# Altium schematic sheet DIO_1.SchDoc
size 420 x 297 mm; SheetNumber: 11; SheetTotal: 26
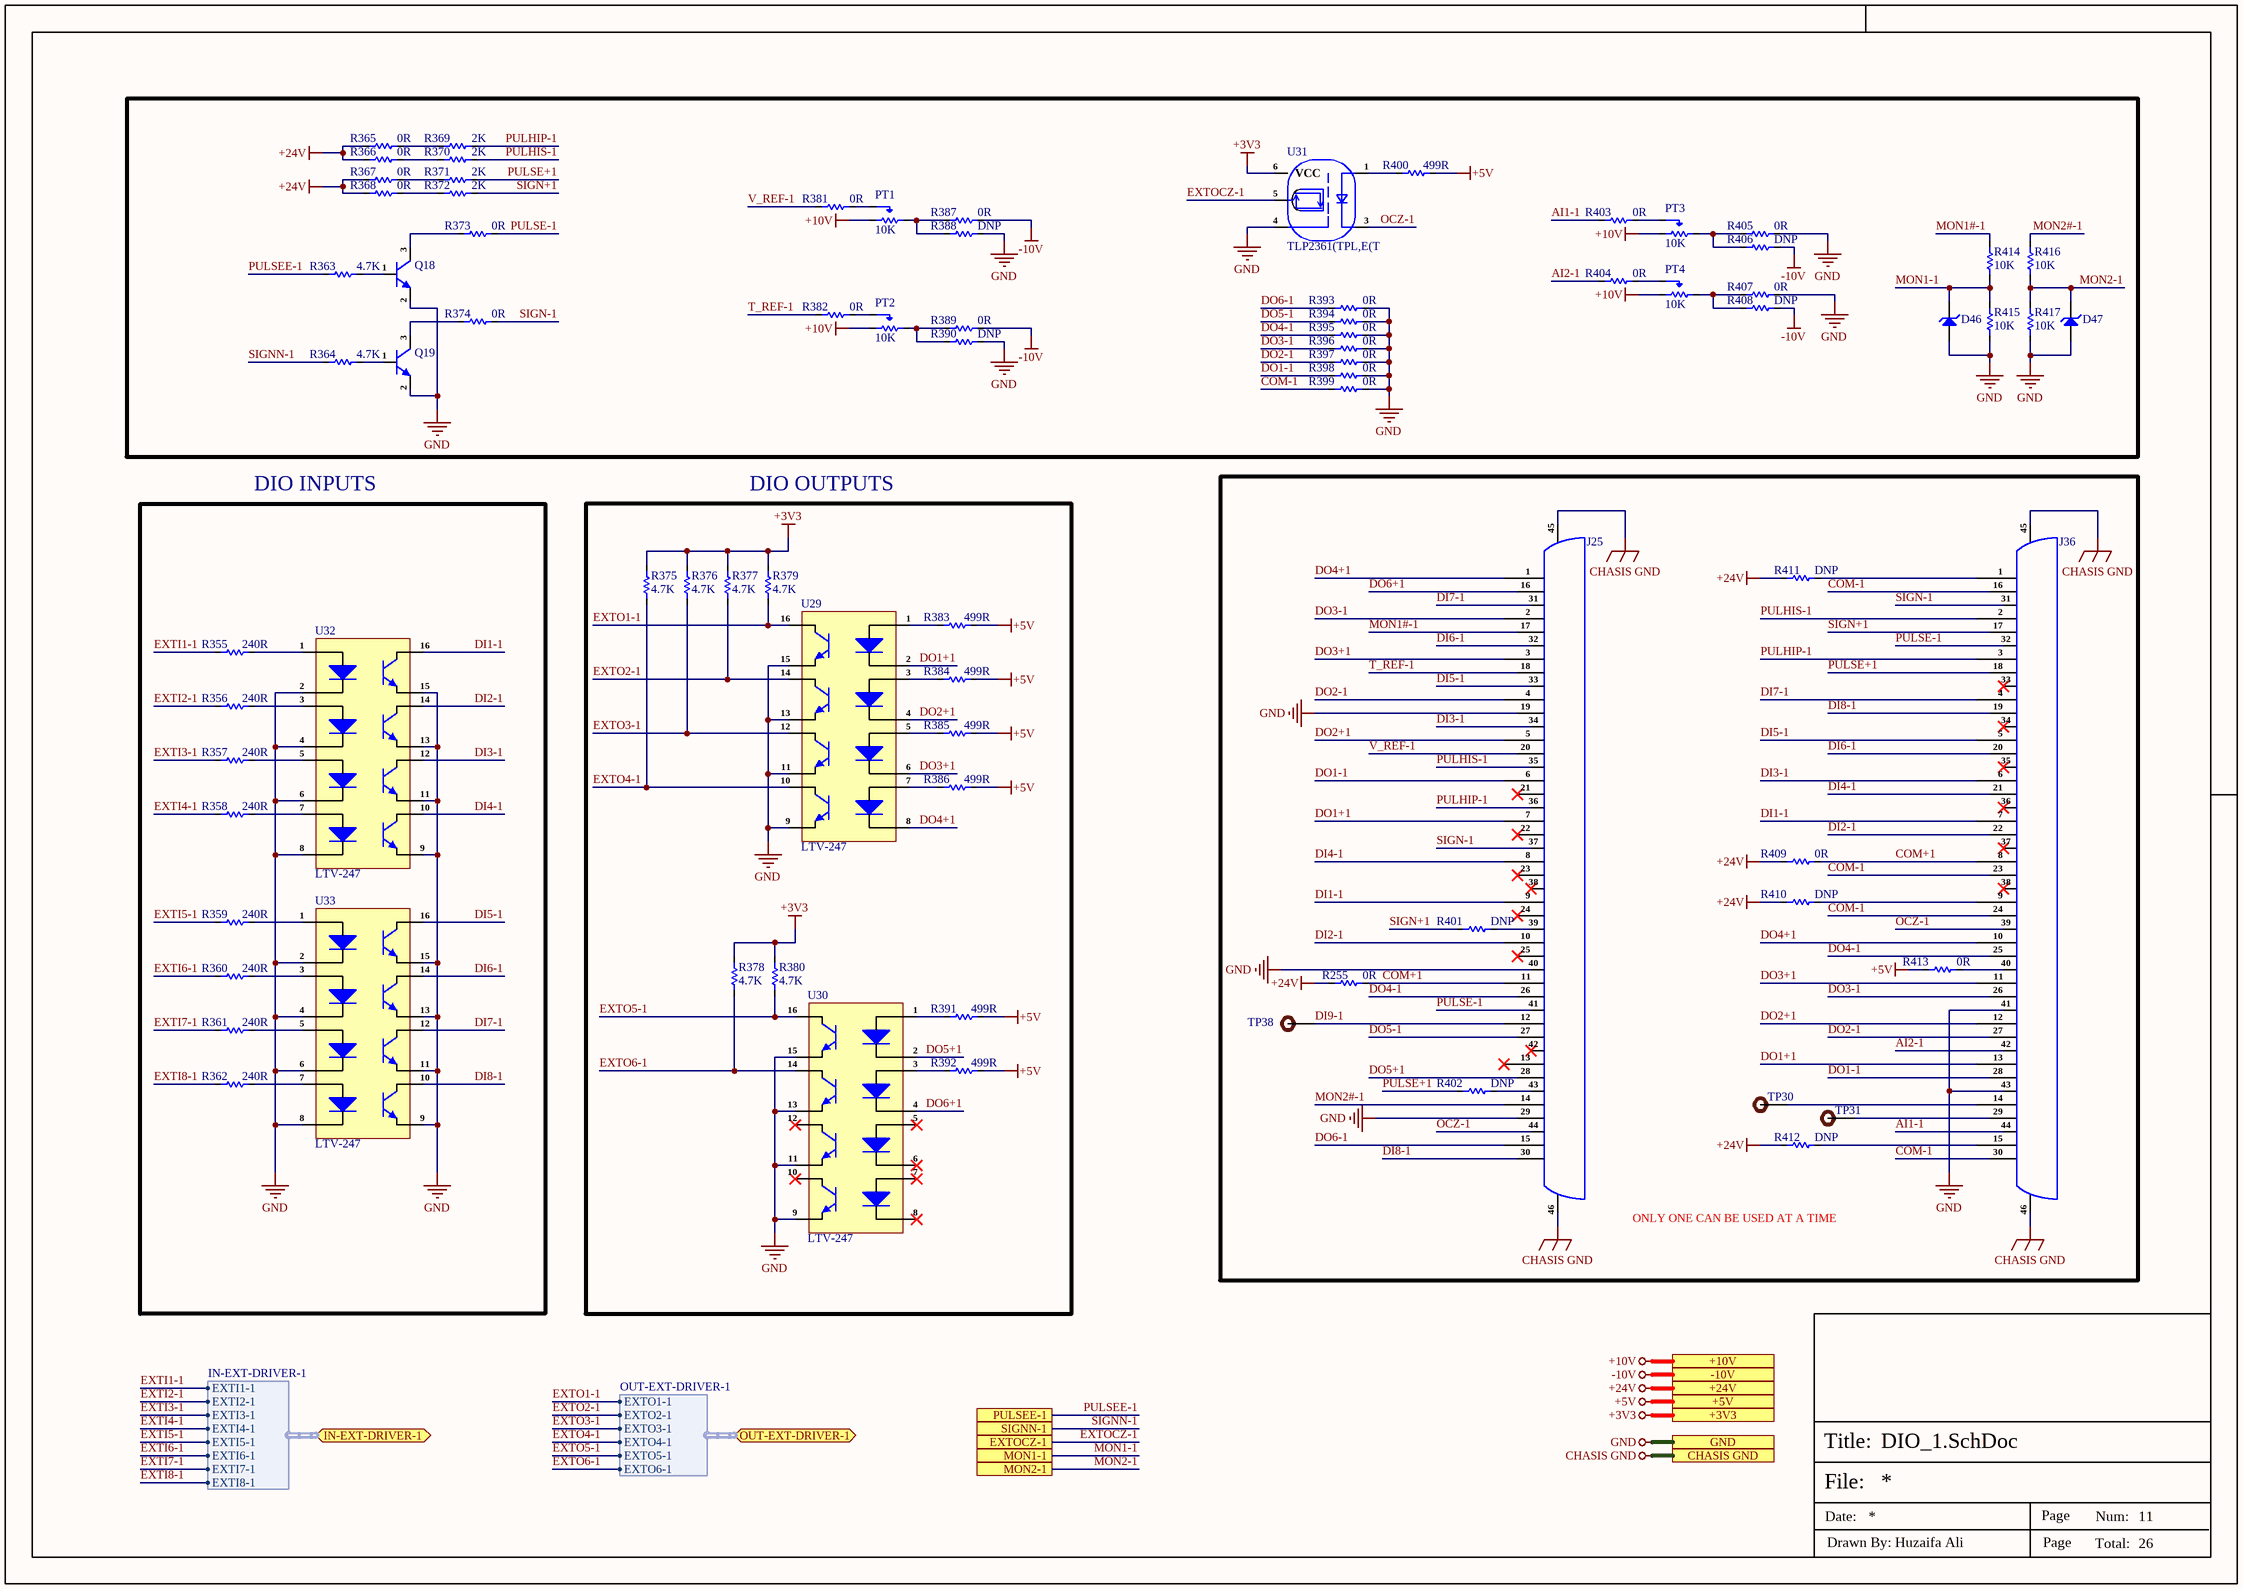
[diagram p0: DIO_1.SchDoc]

## Parts
D46  MM3Z3V3B  [SOD323F]  (value not drawn)
D47  MM3Z3V3B  [SOD323F]  (value not drawn)
J25  DS1038-44FBNSIA74-0CC  [DS1038-44FBNSIA74-0CC]  (value not drawn)
J36  DS1038-44FBNSIA74-0CC  [DS1038-44FBNSIA74-0CC]  (value not drawn)
PT1  10K  [3313J-1-103E]
PT2  10K  [3313J-1-103E]
PT3  10K  [3313J-1-103E]
PT4  10K  [3313J-1-103E]
Q18  NSS40201LT1G  [SOT-23]  (value not drawn)
Q19  NSS40201LT1G  [SOT-23]  (value not drawn)
R255  0R  [Res-0603]
R355  240R  [Res-0402]
R356  240R  [Res-0402]
R357  240R  [Res-0402]
R358  240R  [Res-0402]
R359  240R  [Res-0402]
R360  240R  [Res-0402]
R361  240R  [Res-0402]
R362  240R  [Res-0402]
R363  4.7K  [Res-0402]
R364  4.7K  [Res-0402]
R365  0R  [Res-0402]
R366  0R  [Res-0402]
R367  0R  [Res-0402]
R368  0R  [Res-0402]
R369  2K  [Res-0402]
R370  2K  [Res-0402]
R371  2K  [Res-0402]
R372  2K  [Res-0402]
R373  0R  [Res-0402]
R374  0R  [Res-0402]
R375  4.7K  [Res-0402]
R376  4.7K  [Res-0402]
R377  4.7K  [Res-0402]
R378  4.7K  [Res-0402]
R379  4.7K  [Res-0402]
R380  4.7K  [Res-0402]
R381  0R  [Res-0402]
R382  0R  [Res-0402]
R383  499R  [Res-0402]
R384  499R  [Res-0402]
R385  499R  [Res-0402]
R386  499R  [Res-0402]
R387  0R  [Res-0402]
R388  DNP  [Res-0402]
R389  0R  [Res-0402]
R390  DNP  [Res-0402]
R391  499R  [Res-0402]
R392  499R  [Res-0402]
R393  0R  [Res-0402]
R394  0R  [Res-0402]
R395  0R  [Res-0402]
R396  0R  [Res-0402]
R397  0R  [Res-0402]
R398  0R  [Res-0402]
R399  0R  [Res-0402]
R400  499R  [Res-0402]
R401  DNP  [Res-0402]
R402  DNP  [Res-0402]
R403  0R  [Res-0402]
R404  0R  [Res-0402]
R405  0R  [Res-0402]
R406  DNP  [Res-0402]
R407  0R  [Res-0402]
R408  DNP  [Res-0402]
R409  0R  [Res-0402]
R410  DNP  [Res-0402]
R411  DNP  [Res-0402]
R412  DNP  [Res-0402]
R413  0R  [Res-0402]
R414  10K  [Res-0402]
R415  10K  [Res-0402]
R416  10K  [Res-0402]
R417  10K  [Res-0402]
TP30  TEST POINT 0.5mm Dia  [Test-point - 0.5mm]  (value not drawn)  (no BOM)
TP31  TEST POINT 0.5mm Dia  [Test-point - 0.5mm]  (value not drawn)  (no BOM)
TP38  TEST POINT 0.5mm Dia  [Test-point - 0.5mm]  (value not drawn)  (no BOM)
U29  LTV-247  [16-SO]
U30  LTV-247  [16-SO]
U31  TLP2361(TPL,E(T  [SO-5]
U32  LTV-247  [16-SO]
U33  LTV-247  [16-SO]

## Blocks framed on the sheet
ONLY ONE CAN BE USED AT A TIME: J25 J36 R255 R401 R402 R409-R413 TP30 TP31 TP38

## Ports
+3V3 (see Servo1[5B], CAN_Sheet[4D], Controller_Sheet[5D], DIO_2[5D], DIO_3[5D], DIO_4[5D], Encoder_Sheet1[5D], Encoder_Sheet2[4D], Encoder_Sheet3[4D], Encoder_Sheet4[5D], EtherCAT_Sheet[5D], Motor_Driver_Sheet1[5D], Motor_Driver_Sheet2[5D], Motor_Driver_Sheet3[5D], Motor_Driver_Sheet4[5D], Power_Sheet[5D], RS485_RS232_Sheet[5D], Sec_Controller_Sheet1[5D], Sec_Controller_Sheet2[5D], Sec_Controller_Sheet3[5D], Sec_Controller_Sheet4[5D], Servo1[5D], Servo2[5D], Servo3[5D], Servo4[5D]), +5V (see Servo1[5A], CAN_Sheet[4D], Controller_Sheet[5D], DIO_2[5D], DIO_3[5D], DIO_4[5D], Encoder_Sheet1[5D], Encoder_Sheet2[4D], Encoder_Sheet3[4D], Encoder_Sheet4[5D], Power_Sheet[5D], Servo1[5D], Servo2[5D], Servo3[5D], Servo4[5D]), +10V (see Servo1[5A], DIO_2[5D], DIO_3[5D], DIO_4[5D], Power_Sheet[5D], Servo1[5D], Servo2[5D], Servo3[5D], Servo4[5D]), +24V (see Servo1[5A], DIO_2[5D], DIO_3[5D], DIO_4[5D], Power_Sheet[5D], Servo1[5D], Servo2[5D], Servo3[5D], Servo4[5D]), -10V (see Servo1[5A], DIO_2[5D], DIO_3[5D], DIO_4[5D], Power_Sheet[5D], Servo1[5D], Servo2[5D], Servo3[5D], Servo4[5D]), CHASIS GND (see Servo1[5B], DIO_2[5D], DIO_3[5D], DIO_4[5D], Encoder_Sheet1[5D], Encoder_Sheet2[4D], Encoder_Sheet3[4D], Encoder_Sheet4[5D], EtherCAT_Sheet[5D], Power_Sheet[5D], Servo1[5D], Servo2[5D], Servo3[5D], Servo4[5D]), EXTOCZ-1 (see Servo1[5B], Sec_Controller_Sheet1[5D]), GND (see Servo1[5B], CAN_Sheet[4D], Controller_Sheet[5D], DIO_2[5D], DIO_3[5D], DIO_4[5D], Encoder_Sheet1[5D], Encoder_Sheet2[4D], Encoder_Sheet3[4D], Encoder_Sheet4[5D], EtherCAT_Sheet[5D], Motor_Driver_Sheet1[5D], Motor_Driver_Sheet2[5D], Motor_Driver_Sheet3[5D], Motor_Driver_Sheet4[5D], Power_Sheet[5D], RS485_RS232_Sheet[5D], Sec_Controller_Sheet1[5D], Sec_Controller_Sheet2[5D], Sec_Controller_Sheet3[5D], Sec_Controller_Sheet4[5D], Servo1[5D], Servo2[5D], Servo3[5D], Servo4[5D]), IN-EXT-DRIVER-1 (bidir, harness IN-EXT-DRIVER-1, see Servo1[5B], Sec_Controller_Sheet1[3D]), MON1-1 (see Servo1[5B], Sec_Controller_Sheet1[5D]), MON2-1 (see Servo1[5B], Sec_Controller_Sheet1[5D]), OUT-EXT-DRIVER-1 (bidir, harness OUT-EXT-DRIVER-1, see Servo1[5B], Sec_Controller_Sheet1[3D]), PULSEE-1 (see Servo1[5B], Sec_Controller_Sheet1[5D]), SIGNN-1 (see Servo1[5B], Sec_Controller_Sheet1[5D])

## Harnesses
IN-EXT-DRIVER-1: EXTI1-1, EXTI2-1, EXTI3-1, EXTI4-1, EXTI5-1, EXTI6-1, EXTI7-1, EXTI8-1
OUT-EXT-DRIVER-1: EXTO1-1, EXTO2-1, EXTO3-1, EXTO4-1, EXTO5-1, EXTO6-1

## Nets
+3V3: R375.2 R376.2 R377.2 R378.2 R379.2 R380.2 U31.6(VCC) ; port +3V3
+5V: R383.2 R384.2 R385.2 R386.2 R391.2 R392.2 R400.2 R413.1 ; port +5V
+10V: PT1.1(CCW) PT2.1(CCW) PT3.1(CCW) PT4.1(CCW) ; port +10V
+24V: R255.1 R365.1 R366.1 R367.1 R368.1 R409.1 R410.1 R411.1 R412.1 ; port +24V
-10V: R387.2 R389.2 R406.2 R408.2 ; port -10V
CHASIS GND: J25.45 J25.46 J36.45 J36.46 ; port CHASIS GND
GND: D46.1(A) D47.1(A) J25.19 J25.29 J25.40 J36.41 J36.43 Q18.2(E) Q19.2(E) R388.2 R390.2 R393.2 R394.2 R395.2 R396.2 R397.2 R398.2 R399.2 R405.2 R407.2 R415.1 R417.1 U29.9(E) U29.11(E) U29.13(E) U29.15(E) U30.9(E) U30.11(E) U30.13(E) U30.15(E) U31.4(GND) U32.2(K) U32.4(K) U32.6(K) U32.8(K) U32.9(E) U32.11(E) U32.13(E) U32.15(E) U33.2(K) U33.4(K) U33.6(K) U33.8(K) U33.9(E) U33.11(E) U33.13(E) U33.15(E) ; port GND
AI1-1: J36.44 R403.1
AI2-1: J36.42 R404.1
COM+1: J25.11 J36.8 R255.2 R409.2
COM-1: J36.16 J36.23 J36.24 J36.30 R399.1
DI1-1: J25.9 J36.7 U32.16(C)
DI2-1: J25.10 J36.22 U32.14(C)
DI3-1: J25.34 J36.6 U32.12(C)
DI4-1: J25.8 J36.21 U32.10(C)
DI5-1: J25.33 J36.5 U33.16(C)
DI6-1: J25.32 J36.20 U33.14(C)
DI7-1: J25.31 J36.4 U33.12(C)
DI8-1: J25.30 J36.19 U33.10(C)
DI9-1: J25.12 TP38.1
DO1+1: J25.7 J36.13 U29.2(K)
DO1-1: J25.6 J36.28 R398.1
DO2+1: J25.5 J36.12 U29.4(K)
DO2-1: J25.4 J36.27 R397.1
DO3+1: J25.3 J36.11 U29.6(K)
DO3-1: J25.2 J36.26 R396.1
DO4+1: J25.1 J36.10 U29.8(K)
DO4-1: J25.26 J36.25 R395.1
DO5+1: J25.28 U30.2(K)
DO5-1: J25.27 R394.1
DO6+1: J25.16 U30.4(K)
DO6-1: J25.15 R393.1
EXTI1-1: R355.1 ; port IN-EXT-DRIVER-1.EXTI1-1
EXTI2-1: R356.1 ; port IN-EXT-DRIVER-1.EXTI2-1
EXTI3-1: R357.1 ; port IN-EXT-DRIVER-1.EXTI3-1
EXTI4-1: R358.1 ; port IN-EXT-DRIVER-1.EXTI4-1
EXTI5-1: R359.1 ; port IN-EXT-DRIVER-1.EXTI5-1
EXTI6-1: R360.1 ; port IN-EXT-DRIVER-1.EXTI6-1
EXTI7-1: R361.1 ; port IN-EXT-DRIVER-1.EXTI7-1
EXTI8-1: R362.1 ; port IN-EXT-DRIVER-1.EXTI8-1
EXTO1-1: R379.1 U29.16(C) ; port OUT-EXT-DRIVER-1.EXTO1-1
EXTO2-1: R377.1 U29.14(C) ; port OUT-EXT-DRIVER-1.EXTO2-1
EXTO3-1: R376.1 U29.12(C) ; port OUT-EXT-DRIVER-1.EXTO3-1
EXTO4-1: R375.1 U29.10(C) ; port OUT-EXT-DRIVER-1.EXTO4-1
EXTO5-1: R380.1 U30.16(C) ; port OUT-EXT-DRIVER-1.EXTO5-1
EXTO6-1: R378.1 U30.14(C) ; port OUT-EXT-DRIVER-1.EXTO6-1
EXTOCZ-1: U31.5(VO) ; port EXTOCZ-1
MON1#-1: J25.17 R414.2
MON1-1: D46.2(K) R414.1 R415.2 ; port MON1-1
MON2#-1: J25.14 R416.2
MON2-1: D47.2(K) R416.1 R417.2 ; port MON2-1
OCZ-1: J25.44 J36.39 U31.3(CAT)
PULHIP-1: J25.36 J36.3 R369.2
PULHIS-1: J25.35 J36.2 R370.2
PULSE+1: J36.18 R371.2 R402.1
PULSE-1: J25.41 J36.32 R373.2
PULSEE-1: R363.1 ; port PULSEE-1
SIGN+1: J36.17 R372.2 R401.1
SIGN-1: J25.37 J36.31 R374.2
SIGNN-1: R364.1 ; port SIGNN-1
T_REF-1: J25.18 R382.1
V_REF-1: J25.20 R381.1
NetJ25_39: J25.39 R401.2
NetJ25_43: J25.43 R402.2
NetJ36_1: J36.1 R411.2
NetJ36_9: J36.9 R410.2
NetJ36_14: J36.14 TP30.1
NetJ36_15: J36.15 R412.2
NetJ36_29: J36.29 TP31.1
NetJ36_40: J36.40 R413.2
NetPT1_2: PT1.2(Wiper) R381.2
NetPT1_3: PT1.3(CW) R387.1 R388.1
NetPT2_2: PT2.2(Wiper) R382.2
NetPT2_3: PT2.3(CW) R389.1 R390.1
NetPT3_2: PT3.2(Wiper) R403.2
NetPT3_3: PT3.3(CW) R405.1 R406.1
NetPT4_2: PT4.2(Wiper) R404.2
NetPT4_3: PT4.3(CW) R407.1 R408.1
NetQ18_1: Q18.1(B) R363.2
NetQ18_3: Q18.3(C) R373.1
NetQ19_1: Q19.1(B) R364.2
NetQ19_3: Q19.3(C) R374.1
NetR355_2: R355.2 U32.1(A)
NetR356_2: R356.2 U32.3(A)
NetR357_2: R357.2 U32.5(A)
NetR358_2: R358.2 U32.7(A)
NetR359_2: R359.2 U33.1(A)
NetR360_2: R360.2 U33.3(A)
NetR361_2: R361.2 U33.5(A)
NetR362_2: R362.2 U33.7(A)
NetR365_2: R365.2 R369.1
NetR366_2: R366.2 R370.1
NetR367_2: R367.2 R371.1
NetR368_2: R368.2 R372.1
NetR383_1: R383.1 U29.1(A)
NetR384_1: R384.1 U29.3(A)
NetR385_1: R385.1 U29.5(A)
NetR386_1: R386.1 U29.7(A)
NetR391_1: R391.1 U30.1(A)
NetR392_1: R392.1 U30.3(A)
NetR400_1: R400.1 U31.1(AN)

Not connected (* = marked no-connect by the designer): J25 13* 21* 22* 23* 24* 25* 38* 42*; J36 33* 34* 35* 36* 37* 38*; U30 5(A)* 6(K)* 7(A)* 8(K)* 10(C)* 12(C)*

## Notes on the sheet
- DIO INPUTS
- DIO OUTPUTS
- File:
- Title:
- Date:
- Page
- Num:
- Total:
- Drawn By: Huzaifa Ali

## Library data of the parts
D46 D47 = MM3Z3V3B: DIODE ZENER 3.3V 200MW SOD323F; Manufacturer: ON Semiconductor / Fairchild; Forward Voltage: 1V; Tolerance: 2%; Impedance: 89R; Max Reverse Leakage Current: 4.5uA; Test Current: 5mA; Element Configuration: Single; Supplier 1: Digi-Key; Manufacturer Part Number: MM3Z3V3B; Stock 1: 473644; Pricing 1: 1=0.22, 10=0.18, 100=0.0956, 500=0.06288, 1000=0.04276 (USD); Mount: Surface Mount; Number of Pins: 2; Weight: 0.0276g; Min Operating Temperature: -65°C; Max Operating Temperature: 150°C; Packaging: Tape and Reel; Package Quantity: 1; Max Power Dissipation: 200mW; Zener Voltage: 3.3V; Voltage Tolerance: 2%; Power Dissipation: 200mW; Working Voltage: 3.3V; Peak Reverse Current: 4.5uA; Length: 1.3mm; Height: 1mm; Width: 1.7mm; Radiation Hardening: No; REACH SVHC: No SVHC; Lead Free: Lead Free; ComponentLink1URL: http://www.onsemi.com/pub/Collateral/MM3Z9V1B-D.pdf?src-supplier=Digi-Key; ComponentLink1Description: http://www.onsemi.com/pub/Collateral/MM3Z9V1B-D.pdf?src-supplier=Digi-Key; ComponentLink2URL: http://www.mouser.com/ds/2/149/MM3Z3V3B-187166.pdf?src-supplier=Mouser; ComponentLink2Description: http://www.mouser.com/ds/2/149/MM3Z3V3B-187166.pdf?src-supplier=Mouser; ComponentLink3URL: https://www.fairchildsemi.com/datasheets/MM/MM3Z9V1B.pdf?src-supplier=Avnet; ComponentLink3Description: https://www.fairchildsemi.com/datasheets/MM/MM3Z9V1B.pdf?src-supplier=Avnet; ComponentLink4URL: http://www.farnell.com/datasheets/1706525.pdf?src-supplier=Element14; ComponentLink4Description: http://www.farnell.com/datasheets/1706525.pdf?src-supplier=Element14; Supplier Part Number 1: MM3Z3V3BCT-ND; LCSC Part Number: C2978865; Item Type: Diode
J25 J36 = DS1038-44FBNSIA74-0CC: 44P Female D-Sub Right-Angle 3 1.5A -40℃~+105℃ Push-Pull D-Sub / VGA connector ROHS; Manufacturer: CONNFLY Elec; Manufacturer Part Number: DS1038-44FBNSIA74-0CC; Package: Push-Pull; LCSC Part Number: C77844; Item Type: D-Sub / VGA connector; ComponentLink1Description: LCSC; ComponentLink1URL: https://www.lcsc.com/product-detail/D-Sub-VGA-connector_CONNFLY-Elec-DS1038-44FBNSIA74-0CC_C77844.html
PT1-PT4 = 3313J-1-103E: TRIMMER 10KOHM 0.125W J LEAD TOP; Manufacturer: Bourns; Value: 10kR; Tolerance: 20%; Power Rating: 125mW; Number of Turns: 1; Temperature Coefficient: 100ppm/°C; Insulation Resistance: 100MR; Voltage Rating (DC): 500V; Item Type: Potentiometer; Supplier 1: Digi-Key; Manufacturer Part Number: 3313J-1-103E; RoHS: Yes; Category: Variable Resistors and Potentiometers; Stock 1: 15653; Pricing 1: 1=1.83, 10=1.611, 25=1.4444, 50=1.3888, 100=1.3332, 250=1.27764, 500=1.05544 (USD); Mounting Technology: Surface Mount; Weight: 283mg; Color: Natural; Min Operating Temperature: -55°C; Max Operating Temperature: 125°C; Resistor Type: Cermet; Package Quantity: 1000; Packaging: Tape and Reel; Termination: J-Hook; Taper: Linear; Max Power Dissipation: 125mW; Type: Potentiometer; Series: Trimpot® 3313 - Sealed; Resistance Tolerance: 20%; Technology: CERMET; Length: 3.2mm; Width: 3.2mm; Height: 2.2mm; Depth: 3.5mm; Radiation Hardening: No; Reach SVHC Compliant: No; Military Standard: Not; Lead Free: Lead Free; RoHS Compliant: Yes; ComponentLink1URL: https://datasheet.ciiva.com/6197/1719390-6197392.pdf?src-supplier=Farnell; ComponentLink1Description: https://datasheet.ciiva.com/6197/1719390-6197392.pdf?src-supplier=Farnell; ComponentLink2URL: https://datasheet.ciiva.com/11831/0900766b80dbb89c-11831555.pdf?src-supplier=Rs; ComponentLink2Description: https://datasheet.ciiva.com/11831/0900766b80dbb89c-11831555.pdf?src-supplier=Rs; ComponentLink3URL: https://datasheet.ciiva.com/43573/1157501-43573718.pdf?src-supplier=Jameco; ComponentLink3Description: https://datasheet.ciiva.com/43573/1157501-43573718.pdf?src-supplier=Jameco; ComponentLink4URL: https://datasheet.ciiva.com/7953/1864507-7953225.pdf?src-supplier=Element14; ComponentLink4Description: https://datasheet.ciiva.com/7953/1864507-7953225.pdf?src-supplier=Element14; ComponentLink5URL: https://datasheet.ciiva.com/28659/1770668-28659191.pdf?src-supplier=Element14; ComponentLink5Description: https://datasheet.ciiva.com/28659/1770668-28659191.pdf?src-supplier=Element14; ComponentLink6URL: https://datasheet.ciiva.com/2156/3313-2156355.pdf?src-supplier=Digi-Key; ComponentLink6Description: https://datasheet.ciiva.com/2156/3313-2156355.pdf?src-supplier=Digi-Key; ComponentLink7URL: https://datasheet.ciiva.com/2156/3313-2156356.pdf?src-supplier=Digi-Key; ComponentLink7Description: https://datasheet.ciiva.com/2156/3313-2156356.pdf?src-supplier=Digi-Key; ComponentLink8URL: https://datasheet.ciiva.com/2156/3313-2156354.pdf?src-supplier=Digi-Key; ComponentLink8Description: https://datasheet.ciiva.com/2156/3313-2156354.pdf?src-supplier=Digi-Key; ComponentLink9URL: https://datasheet.ciiva.com/16715/70153423-16715693.pdf?src-supplier=Allied+Electronics; ComponentLink9Description: https://datasheet.ciiva.com/16715/70153423-16715693.pdf?src-supplier=Allied+Electronics; Supplier Part Number 1: 3313J-103ECT-ND; LCSC Part Number: C124616
Q18 Q19 = NSS40201LT1G: TRANS NPN 40V 2A SOT23-3; Manufacturer: ON Semiconductor; Max Power Dissipation: 540mW; Transition Frequency: 150MHz; hFE Min: 200; Number of Elements: 1; Emitter Base Voltage (VEBO): 6V; Collector Emitter Saturation Voltage: 115mV; Element Configuration: Single; Clock Frequency: 100MHz; Item Type: Transistor; Supplier 1: Future Electronics; Manufacturer Part Number: NSS40201LT1G; RoHS: Yes; Category: BJTs; Stock 1: 155; Pricing 1: 1=0.42000, 15=0.34000, 75=0.29500, 300=0.25500, 1500=0.21000 (USD); Case/Package: SOT-23-3; Pins: 3; Min Operating Temperature: -55°C; Max Operating Temperature: 150°C; Collector Emitter Voltage (VCEO): 40V; Packaging: Tape and Reel; Max Collector Current: 2A; Collector Emitter Breakdown Voltage: 40V; Polarity: NPN; Package Quantity: 3000; Frequency: 150MHz; Max Breakdown Voltage: 40V; Collector Base Voltage (VCBO): 40V; Power Dissipation: 540mW; Gain Bandwidth Product: 150MHz; Series: -; Collector-emitter Voltage-Max: 115mV; Length: 3.04mm; Width: 2.64mm; Height: 1.11mm; Radiation Hardening: No; Lead Free: Lead Free; Reach SVHC Compliant: Yes; Halogen Free: Halogen Free; RoHS Compliant: Yes; ComponentLink1URL: https://datasheet.ciiva.com/976/nss40201l-d-976800.pdf?src-supplier=Digi-Key; ComponentLink1Description: https://datasheet.ciiva.com/976/nss40201l-d-976800.pdf?src-supplier=Digi-Key; ComponentLink2URL: https://datasheet.ciiva.com/11204/nss40201l-d-11204882.pdf?src-supplier=Avnet; ComponentLink2Description: https://datasheet.ciiva.com/11204/nss40201l-d-11204882.pdf?src-supplier=Avnet; ComponentLink3URL: https://datasheet.ciiva.com/16291/nss40201l-d-115376-16291797.pdf?src-supplier=Mouser; ComponentLink3Description: https://datasheet.ciiva.com/16291/nss40201l-d-115376-16291797.pdf?src-supplier=Mouser; ComponentLink4URL: https://datasheet.ciiva.com/30480/0900766b8121b5a5-30480502.pdf?src-supplier=Rs; ComponentLink4Description: https://datasheet.ciiva.com/30480/0900766b8121b5a5-30480502.pdf?src-supplier=Rs; ComponentLink5URL: https://datasheet.ciiva.com/976/nss40201l-d-976801.pdf?src-supplier=Digi-Key; ComponentLink5Description: https://datasheet.ciiva.com/976/nss40201l-d-976801.pdf?src-supplier=Digi-Key; ComponentLink6URL: https://datasheet.ciiva.com/976/nss40201l-d-976802.pdf?src-supplier=Digi-Key; ComponentLink6Description: https://datasheet.ciiva.com/976/nss40201l-d-976802.pdf?src-supplier=Digi-Key; ComponentLink7URL: https://datasheet.ciiva.com/22641/nss40201l-d-22641179.pdf?src-supplier=Farnell; ComponentLink7Description: https://datasheet.ciiva.com/22641/nss40201l-d-22641179.pdf?src-supplier=Farnell; ComponentLink8URL: https://datasheet.ciiva.com/16222/nss40201l-d-16222093.pdf?src-supplier=Future+Electronics; ComponentLink8Description: https://datasheet.ciiva.com/16222/nss40201l-d-16222093.pdf?src-supplier=Future+Electronics; Supplier Part Number 1: 6030674; LCSC Part Number: C145175
R255 = RC0603JR-070RL: RES 0 OHM JUMPER 1/10W 0603; Manufacturer: Yageo; Resistance: 0mR; Tolerance: 1%; Power Rating: 100mW; Voltage Rating (DC): 50V; Temperature Coefficient: 200ppm/°C; Resistance Tolerance: 5%; Item Type: Resistor; Supplier 1: Digi-Key; Manufacturer Part Number: RC0603JR-070RL; RoHS: Yes; Category: Chip SMD Resistors; Stock 1: 18081776; Pricing 1: 1=0.10000, 10=0.01700, 25=0.01240, 50=0.00960, 100=0.00700, 250=0.00536, 500=0.00430, 1000=0.00316 (USD); Case/Package: 0603; Number of Pins: 2; Contact Plating: Tin,Matte; Case Code (Imperial): 0603; Case Code (Metric): 1608; Size Code: 0603; Min Operating Temperature: -55°C; Max Operating Temperature: 155°C; Resistor Type: Thick Film; Packaging: Tape and Reel; Termination: SMD/SMT; Series: RC; Technology: THICK FILM; Package Quantity: 5000; Voltage Rating: 50V; Features: Moisture Resistant; Max Power Dissipation: 100mW; Number of Terminations: 2; Construction: Rectangular; Length: 1.6mm; Width: 0.8mm; Height: 0.45mm; Depth: 0.8mm; Radiation Hardening: No; Reach SVHC Compliant: No SVHC; Lead Free: Lead Free; RoHS Compliant: Yes; Military Standard: Not; Supplier Part Number 1: 311-0.0GRCT-ND; LCSC Part Number: C95177
R355-R362 = RC0402FR-07240RL: RES 240 OHM 1% 1/16W 0402; Manufacturer: Yageo; Item Type: Resistors; Power Rating: 63mW; Temperature Coefficient: 100ppm/°C; Voltage Rating (DC): 50V; Supplier 1: Mouser; Manufacturer Part Number: RC0402FR-07240RL; RoHS: Yes; Stock 1: 1903202; Pricing 1: 1=0.10000, 10=0.01200, 50=0.01200, 100=0.00500, 1000=0.00300, 10000=0.00100 (USD); Case/Package: 0402; Case Code (Metric): 1005; Case Code (Imperial): 0402; Size Code: 0402; Min Operating Temperature: -55°C; Max Operating Temperature: 155°C; Resistance: 240R; Tolerance: 1%; Packaging: Tape and Reel; Resistor Type: Thick Film; Voltage Rating: 50V; Package Quantity: 1; Number of Terminations: 2; Termination: SMD/SMT; Max Power Dissipation: 63mW; Features: Moisture Resistant; Series: RC; Construction: Rectangular; Resistance Tolerance: 1%; Length: 1mm; Width: 0.02inch; Height: 0.016inch; Depth: 0.5mm; REACH SVHC: Unknown; Lead Free: Lead Free; RoHS Compliant: Yes; Military Standard: Not; ComponentLink1URL: https://datasheet.ciiva.com/7849/1018594-7849915.pdf?src-supplier=Element14; ComponentLink1Description: https://datasheet.ciiva.com/7849/1018594-7849915.pdf?src-supplier=Element14; ComponentLink2URL: https://datasheet.ciiva.com/7849/1018594-7849916.pdf?src-supplier=Element14; ComponentLink2Description: https://datasheet.ciiva.com/7849/1018594-7849916.pdf?src-supplier=Element14; ComponentLink3URL: https://datasheet.ciiva.com/2519/pyu-r-int-thick-7-2519157.pdf?src-supplier=Digi-Key; ComponentLink3Description: https://datasheet.ciiva.com/2519/pyu-r-int-thick-7-2519157.pdf?src-supplier=Digi-Key; ComponentLink4URL: https://datasheet.ciiva.com/2519/pyu-r-int-thick-7-2519158.pdf?src-supplier=Digi-Key; ComponentLink4Description: https://datasheet.ciiva.com/2519/pyu-r-int-thick-7-2519158.pdf?src-supplier=Digi-Key; ComponentLink5URL: https://datasheet.ciiva.com/2519/pyu-r-int-thick-7-2519156.pdf?src-supplier=Digi-Key; ComponentLink5Description: https://datasheet.ciiva.com/2519/pyu-r-int-thick-7-2519156.pdf?src-supplier=Digi-Key; ComponentLink6URL: https://datasheet.ciiva.com/12669/pyu-rc0402-51-rohs-l-6-r-12669689.pdf?src-supplier=Mouser; ComponentLink6Description: https://datasheet.ciiva.com/12669/pyu-rc0402-51-rohs-l-6-r-12669689.pdf?src-supplier=Mouser; ComponentLink7URL: https://datasheet.ciiva.com/17419/pyu-rc0402-51-rohs-l-6-r-17419482.pdf?src-supplier=Future+Electronics; ComponentLink7Description: https://datasheet.ciiva.com/17419/pyu-rc0402-51-rohs-l-6-r-17419482.pdf?src-supplier=Future+Electronics; Supplier Part Number 1: 603-RC0402FR-07240RL; LCSC Part Number: C114755
R363 R364 R375-R380 = RC0402FR-074K7L: RES 4.7K OHM 1% 1/16W 0402; Manufacturer: Yageo; Voltage Rating (DC): 50V; Power Rating: 62.5mW; Resistance: 4.7kR; Temperature Coefficient: 100ppm/°C; Max Power Dissipation: 63mW; Item Type: Resistor; Supplier 1: Avnet; Manufacturer Part Number: RC0402FR-074K7L; RoHS: Yes; Category: Chip SMD Resistors; Stock 1: 2420000; Pricing 1: 10000=0.00085 (USD); Case/Package: 0402; Number of Pins: 2; Case Code (Imperial): 0402; Case Code (Metric): 1005; Size Code: 0402; Min Operating Temperature: -55°C; Max Operating Temperature: 155°C; Tolerance: 1%; Voltage Rating: 50V; Packaging: Tape and Reel; Resistor Type: Thick Film; Termination: SMD/SMT; Features: Moisture Resistant; Series: RC; Number of Terminations: 2; Resistance Tolerance: 1%; Construction: Rectangular; Length: 1mm; Width: 0.5mm; Height: 0.32mm; Depth: 0.5mm; Height - Seated (Max): 0.016inch; RoHS Compliant: Yes; Reach SVHC Compliant: Yes; Military Standard: Not; Lead Free: Lead Free; ComponentLink1URL: https://datasheet.ciiva.com/22661/1686128-22661342.pdf?src-supplier=Element14; ComponentLink1Description: https://datasheet.ciiva.com/22661/1686128-22661342.pdf?src-supplier=Element14; ComponentLink2URL: https://datasheet.ciiva.com/7850/1018594-7850022.pdf?src-supplier=Element14; ComponentLink2Description: https://datasheet.ciiva.com/7850/1018594-7850022.pdf?src-supplier=Element14; ComponentLink3URL: https://datasheet.ciiva.com/7850/1018594-7850023.pdf?src-supplier=Element14; ComponentLink3Description: https://datasheet.ciiva.com/7850/1018594-7850023.pdf?src-supplier=Element14; ComponentLink4URL: https://datasheet.ciiva.com/15215/getdatasheetpartid-328119-15215035.pdf?src-supplier=Verical; ComponentLink4Description: https://datasheet.ciiva.com/15215/getdatasheetpartid-328119-15215035.pdf?src-supplier=Verical; Supplier Part Number 1: RC0402FR-074K7L; LCSC Part Number: C105871
R365-R368 R373 R374 R381 R382 R387 R389 R393-R399 R403-R405 R407 R409 R413 = RC0402FR-070RL: RES 0 OHM JUMPER 1/16W 0402; Manufacturer: Yageo; Item Type: Resistors; Tolerance: 1%; Power Rating: 62.5mW; Voltage Rating: 50V; Temperature Coefficient: 200ppm/°C; Max Power Dissipation: 63mW; Supplier 1: Mouser; Manufacturer Part Number: RC0402FR-070RL; RoHS: Yes; Stock 1: 8556842; Pricing 1: 1=0.10000, 10=0.01400, 50=0.01400, 100=0.00600, 1000=0.00300, 5000=0.00200, 10000=0.00100 (USD); Mount: Surface Mount; Case/Package: 0402; Contact Plating: Tin,Matte; Case Code (Imperial): 0402; Case Code (Metric): 1005; Size Code: 0402; Min Operating Temperature: -55°C; Max Operating Temperature: 155°C; Resistance: 0R; Resistor Type: Thick Film; Packaging: Tape and Reel; Termination: SMD/SMT; Features: Moisture Resistant; Series: RC; Number of Terminations: 2; Length: 1mm; Width: 0.5mm; Height: 0.35mm; Radiation Hardening: No; Lead Free: Lead Free; RoHS Compliant: Yes; ComponentLink1URL: https://datasheet.ciiva.com/8896/pyu-rc0402-51-rohs-l-6-8896149.pdf?src-supplier=Avnet; ComponentLink1Description: https://datasheet.ciiva.com/8896/pyu-rc0402-51-rohs-l-6-8896149.pdf?src-supplier=Avnet; ComponentLink2URL: https://datasheet.ciiva.com/16790/pyu-rc0402-51-rohs-l-6-r-16790444.pdf?src-supplier=Future+Electronics; ComponentLink2Description: https://datasheet.ciiva.com/16790/pyu-rc0402-51-rohs-l-6-r-16790444.pdf?src-supplier=Future+Electronics; Supplier Part Number 1: 603-RC0402FR-070RL; LCSC Part Number: C106231
R369-R372 = RC0402FR-072KL: RES 2K OHM 1% 1/16W 0402; Manufacturer: Yageo; Item Type: Resistor; Value: 2kR; Power Rating: 63mW; Voltage Rating: 50V; Temperature Coefficient: 100ppm/°C; LCSC Part Number: C60488; ComponentLink2URL: https://datasheet.ciiva.com/11808/0900766b80c66297-11808787.pdf?src-supplier=Rs; ComponentLink2Description: https://datasheet.ciiva.com/11808/0900766b80c66297-11808787.pdf?src-supplier=Rs; ComponentLink3URL: https://datasheet.ciiva.com/7849/1018594-7849934.pdf?src-supplier=Element14; ComponentLink3Description: https://datasheet.ciiva.com/7849/1018594-7849934.pdf?src-supplier=Element14; ComponentLink4URL: https://datasheet.ciiva.com/7849/1018594-7849935.pdf?src-supplier=Element14; ComponentLink4Description: https://datasheet.ciiva.com/7849/1018594-7849935.pdf?src-supplier=Element14; ComponentLink5URL: https://datasheet.ciiva.com/7983/1018594-7983517.pdf?src-supplier=Element14; ComponentLink5Description: https://datasheet.ciiva.com/7983/1018594-7983517.pdf?src-supplier=Element14; ComponentLink6URL: https://datasheet.ciiva.com/2453/pyu-r-int-thick-7-2453635.pdf?src-supplier=Digi-Key; ComponentLink6Description: https://datasheet.ciiva.com/2453/pyu-r-int-thick-7-2453635.pdf?src-supplier=Digi-Key; ComponentLink7URL: https://datasheet.ciiva.com/2453/pyu-r-int-thick-7-2453636.pdf?src-supplier=Digi-Key; ComponentLink7Description: https://datasheet.ciiva.com/2453/pyu-r-int-thick-7-2453636.pdf?src-supplier=Digi-Key; ComponentLink8URL: https://datasheet.ciiva.com/2453/pyu-r-int-thick-7-2453634.pdf?src-supplier=Digi-Key; ComponentLink8Description: https://datasheet.ciiva.com/2453/pyu-r-int-thick-7-2453634.pdf?src-supplier=Digi-Key; ComponentLink9URL: https://datasheet.ciiva.com/12667/pyu-rc0402-51-rohs-l-6-r-12667451.pdf?src-supplier=Mouser; ComponentLink9Description: https://datasheet.ciiva.com/12667/pyu-rc0402-51-rohs-l-6-r-12667451.pdf?src-supplier=Mouser; ComponentLink10URL: https://datasheet.ciiva.com/15189/getdatasheetpartid-358921-15189414.pdf?src-supplier=Verical; ComponentLink10Description: https://datasheet.ciiva.com/15189/getdatasheetpartid-358921-15189414.pdf?src-supplier=Verical; Supplier: Future Electronics; Supplier Part Number: 7970452; Manufacturer Part Number: RC0402FR-072KL; RoHS: Yes; Category: Chip SMD Resistors; Stock: 8530000; Pricing: 10000=0.0018, 100000=0.0011, 200000=0.0017, 300000=0.001, 750000=0.0016, 2000000=0.0009, 2500000=0.0016, 10000000=0.0014 (USD); Case/Package: 0402; Case Code (Metric): 1005; Case Code (Imperial): 0402; Min Operating Temperature: -55°C; Max Operating Temperature: 155°C; Resistor Type: Thick Film; Tolerance: 1%; Package Quantity: 1; Packaging: Tape and Reel; Number of Terminations: 2; Termination: SMD/SMT; Max Power Dissipation: 63mW; Working Voltage: 50V; Features: Moisture Resistant; Series: RC; Technology: THICK FILM; Construction: Rectangular; Resistance Tolerance: 1%; Voltage Rating (DC): 50V; Length: 0.039inch; Width: 0.02inch; Height: 0.016inch; Depth: 0.5mm; RoHS Compliant: Yes; Military Standard: Not; Reach SVHC Compliant: Unknown; Lead Free: 5697LeadFree; ComponentLink1URL: https://datasheet.ciiva.com/11808/0900766b80c66297-11808787.pdf?src-supplier=Rs; ComponentLink1Description: https://datasheet.ciiva.com/11808/0900766b80c66297-11808787.pdf?src-supplier=Rs; ComponentLink11URL: https://datasheet.ciiva.com/2453/pyu-r-int-thick-7-2453635.pdf?src-supplier=Digikey; ComponentLink11Description: https://datasheet.ciiva.com/2453/pyu-r-int-thick-7-2453635.pdf?src-supplier=Digikey; ComponentLink12URL: https://datasheet.ciiva.com/2453/pyu-r-int-thick-7-2453636.pdf?src-supplier=Digikey; ComponentLink12Description: https://datasheet.ciiva.com/2453/pyu-r-int-thick-7-2453636.pdf?src-supplier=Digikey; ComponentLink13URL: https://datasheet.ciiva.com/2453/pyu-r-int-thick-7-2453634.pdf?src-supplier=Digikey; ComponentLink13Description: https://datasheet.ciiva.com/2453/pyu-r-int-thick-7-2453634.pdf?src-supplier=Digikey
R383-R386 R391 R392 R400 = RC0402FR-07499RL: RES 499 OHM 1% 1/16W 0402; Manufacturer: Yageo; Power Rating: 62.5mW; Voltage Rating: 50V; Max Power Dissipation: 63mW; Temperature Coefficient: 100ppm/°C; Supplier 1: Mouser; Manufacturer Part Number: RC0402FR-07499RL; RoHS: Yes; Category: Chip SMD Resistors; Stock 1: 936879; Pricing 1: 1=0.10000, 10=0.01200, 50=0.01200, 100=0.00500, 1000=0.00300, 10000=0.00100 (USD); Case/Package: 0402; Case Code (Metric): 1005; Case Code (Imperial): 0402; Size Code: 0402; Min Operating Temperature: -55°C; Max Operating Temperature: 155°C; Resistance: 499R; Tolerance: 1%; Package Quantity: 1; Packaging: Tape and Reel; Resistor Type: Thick Film; Number of Terminations: 2; Termination: SMD/SMT; Voltage Rating (DC): 50V; Features: Moisture Resistant; Series: RC; Resistance Tolerance: 1%; Construction: Rectangular; Length: 1mm; Width: 0.02inch; Height: 0.016inch; Depth: 0.5mm; RoHS Compliant: Yes; REACH SVHC: No SVHC; Military Standard: Not; Lead Free: Lead Free; ComponentLink1URL: https://datasheet.ciiva.com/2453/pyu-r-int-thick-7-2453539.pdf?src-supplier=Digi-Key; ComponentLink1Description: https://datasheet.ciiva.com/2453/pyu-r-int-thick-7-2453539.pdf?src-supplier=Digi-Key; ComponentLink2URL: https://datasheet.ciiva.com/2453/pyu-r-int-thick-7-2453540.pdf?src-supplier=Digi-Key; ComponentLink2Description: https://datasheet.ciiva.com/2453/pyu-r-int-thick-7-2453540.pdf?src-supplier=Digi-Key; ComponentLink3URL: https://datasheet.ciiva.com/2453/pyu-r-int-thick-7-2453538.pdf?src-supplier=Digi-Key; ComponentLink3Description: https://datasheet.ciiva.com/2453/pyu-r-int-thick-7-2453538.pdf?src-supplier=Digi-Key; Supplier Part Number 1: 603-RC0402FR-07499RL; LCSC Part Number: C137970
R388 R390 R401 R402 R406 R408 R410-R412 = RC0402FR-070RL: RES 0 OHM JUMPER 1/16W 0402; Manufacturer: Yageo; Item Type: Resistors; Resistance: 0R; Tolerance: 1%; Power Rating: 62.5mW; Voltage Rating: 50V; Temperature Coefficient: 200ppm/°C; Max Power Dissipation: 63mW; Supplier 1: Mouser; Manufacturer Part Number: RC0402FR-070RL; RoHS: Yes; Stock 1: 8556842; Pricing 1: 1=0.10000, 10=0.01400, 50=0.01400, 100=0.00600, 1000=0.00300, 5000=0.00200, 10000=0.00100 (USD); Mount: Surface Mount; Case/Package: 0402; Contact Plating: Tin,Matte; Case Code (Imperial): 0402; Case Code (Metric): 1005; Size Code: 0402; Min Operating Temperature: -55°C; Max Operating Temperature: 155°C; Resistor Type: Thick Film; Packaging: Tape and Reel; Termination: SMD/SMT; Features: Moisture Resistant; Series: RC; Number of Terminations: 2; Length: 1mm; Width: 0.5mm; Height: 0.35mm; Radiation Hardening: No; Lead Free: Lead Free; RoHS Compliant: Yes; ComponentLink1URL: https://datasheet.ciiva.com/8896/pyu-rc0402-51-rohs-l-6-8896149.pdf?src-supplier=Avnet; ComponentLink1Description: https://datasheet.ciiva.com/8896/pyu-rc0402-51-rohs-l-6-8896149.pdf?src-supplier=Avnet; ComponentLink2URL: https://datasheet.ciiva.com/16790/pyu-rc0402-51-rohs-l-6-r-16790444.pdf?src-supplier=Future+Electronics; ComponentLink2Description: https://datasheet.ciiva.com/16790/pyu-rc0402-51-rohs-l-6-r-16790444.pdf?src-supplier=Future+Electronics; Supplier Part Number 1: 603-RC0402FR-070RL; LCSC Part Number: C106231
R414-R417 = RC0402FR-0710KL: RES 10K OHM 1% 1/16W 0402; Manufacturer: Yageo; Resistance: 10kR; Voltage Rating (DC): 50V; Temperature Coefficient: 100ppm/°C; Power Rating: 62.5mW; Max Power Dissipation: 63mW; Item Type: Resistor; Supplier 1: Mouser; Manufacturer Part Number: RC0402FR-0710KL; RoHS: Yes; Category: Chip SMD Resistors; Stock 1: 18648329; Pricing 1: 1=0.10000, 10=0.01400, 50=0.01400, 100=0.00500, 1000=0.00300, 10000=0.00200 (USD); Case/Package: 0402; Number of Pins: 2; Case Code (Imperial): 0402; Case Code (Metric): 1005; Min Operating Temperature: -55°C; Max Operating Temperature: 155°C; Resistor Type: Thick Film; Tolerance: 1%; Packaging: Tape and Reel; Voltage Rating: 50V; Termination: SMD/SMT; Working Voltage: 50V; Number of Terminations: 2; Features: Moisture Resistant; Series: RC; Resistance Tolerance: 1%; Construction: Rectangular; Length: 1mm; Width: 0.5mm; Height: 0.32mm; Depth: 0.5mm; Lead Pitch: 0.2mm; REACH SVHC: No SVHC; Lead Free: Lead Free; RoHS Compliant: Yes; Military Standard: Not; ComponentLink1URL: https://datasheet.ciiva.com/7660/38568-7660787.pdf?src-supplier=Element14; ComponentLink1Description: https://datasheet.ciiva.com/7660/38568-7660787.pdf?src-supplier=Element14; ComponentLink2URL: https://datasheet.ciiva.com/7849/1686128-7849814.pdf?src-supplier=Element14; ComponentLink2Description: https://datasheet.ciiva.com/7849/1686128-7849814.pdf?src-supplier=Element14; ComponentLink3URL: https://datasheet.ciiva.com/7983/1018594-7983486.pdf?src-supplier=Element14; ComponentLink3Description: https://datasheet.ciiva.com/7983/1018594-7983486.pdf?src-supplier=Element14; ComponentLink4URL: https://datasheet.ciiva.com/22747/1018594-22747512.pdf?src-supplier=Element14; ComponentLink4Description: https://datasheet.ciiva.com/22747/1018594-22747512.pdf?src-supplier=Element14; ComponentLink5URL: https://datasheet.ciiva.com/12667/pyu-rc0402-51-rohs-l-6-r-12667067.pdf?src-supplier=Mouser; ComponentLink5Description: https://datasheet.ciiva.com/12667/pyu-rc0402-51-rohs-l-6-r-12667067.pdf?src-supplier=Mouser; ComponentLink6URL: https://datasheet.ciiva.com/7849/1784430-7849813.pdf?src-supplier=Element14; ComponentLink6Description: https://datasheet.ciiva.com/7849/1784430-7849813.pdf?src-supplier=Element14; ComponentLink7URL: https://datasheet.ciiva.com/7849/1784430-7849815.pdf?src-supplier=Element14; ComponentLink7Description: https://datasheet.ciiva.com/7849/1784430-7849815.pdf?src-supplier=Element14; Supplier Part Number 1: 603-RC0402FR-0710KL; LCSC Part Number: C60490
TP30 TP31 TP38 = TEST POINT 0.5mm Dia: Test Point ON; Item Type: Test Point; Manufacturer Part Number: TEST POINT 0.5mm Dia
U29 U30 U32 U33 = LTV-247: OPTOISO 3.75KV 4CH TRANS 16SO; Manufacturer: Vishay Lite-On; Number of Channels: 4; Collector Emitter Voltage (VCEO): 80V; Reverse Breakdown Voltage: 6V; Forward Voltage: 1.2V; Forward Current: 20mA; Max Power Dissipation: 200mW; Output Current per Channel: 50mA; Collector Emitter Saturation Voltage: 400mV; Power Dissipation: 170mW; Current Transfer Ratio: 600%; Item Type: PhotoTransistor; Supplier 1: Future Electronics; Manufacturer Part Number: LTV-247; RoHS: Yes; Category: Optocouplers; Stock 1: 178000; Pricing 1: 2000=0.77000 (USD); Mount: Surface Mount; Case/Package: SMD/SMT; Number of Pins: 16; Min Operating Temperature: -55°C; Max Operating Temperature: 110°C; Package Quantity: 2000; Packaging: Tape and Reel; Max Output Voltage: 80V; Max Collector Current: 50mA; Number of Elements: 4; Max Input Current: 50mA; Radiation Hardening: No; RoHS Compliant: Yes; ComponentLink1URL: https://datasheet.ciiva.com/24015/ltv-247-256860-24015561.pdf?src-supplier=Mouser; ComponentLink1Description: https://datasheet.ciiva.com/24015/ltv-247-256860-24015561.pdf?src-supplier=Mouser; ComponentLink2URL: https://datasheet.ciiva.com/29730/ltv-214-244-29730320.pdf?src-supplier=Digi-Key; ComponentLink2Description: https://datasheet.ciiva.com/29730/ltv-214-244-29730320.pdf?src-supplier=Digi-Key; Supplier Part Number 1: 3051235; LCSC Part Number: C115451; ComponentLink3Description: LCSC; ComponentLink3URL: https://www.lcsc.com/product-detail/Optocouplers-Phototransistor-Output_Lite-On-LTV-247_C115451.html
U31 = TLP2361(TPL,E(T: 15Mbit/s 80ns 2.7V~5.5V 20kV/us DC SO-5 Logic Output Optoisolators ROHS; Manufacturer: Toshiba; Supplier: Arrow Electronics; LCSC Part Number: C107626; Manufacturer Part Number: TLP2361(TPL,E(T; RoHS: No; Stock: 15000; Pricing: 3000=0.3233, 6000=0.3199, 9000=0.3167, 12000=0.3136, 15000=0.3102, 30000=0.3071 (USD); ComponentLink1URL: https://datasheet.octopart.com/TLP2361%28TPL%2CE%28T-Toshiba-datasheet-62094047.pdf?src-supplier=TME; ComponentLink1Description: https://datasheet.octopart.com/TLP2361%28TPL%2CE%28T-Toshiba-datasheet-62094047.pdf?src-supplier=TME; Item Type: Optoisolator